# Altium project Hall_Voltage.PrjPcb
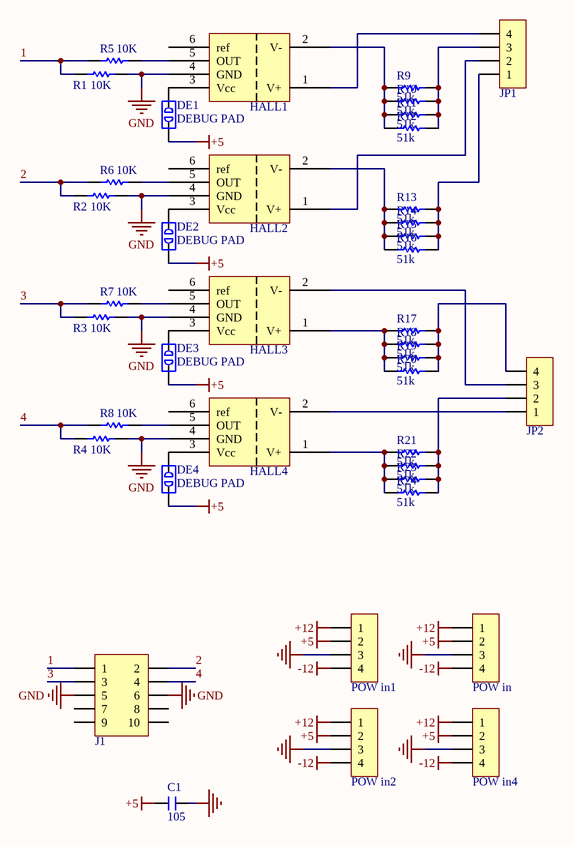
[diagram p0: Hall_Voltage.SchDoc]
1 sheet, 40 parts. Net scope: global (net labels, ports and power ports of the same name join across sheets).
Board file: Hall_Voltage.PcbDoc

## Sheet Hall_Voltage.SchDoc
size A4; Organization: Altium Limited; Address1: L3, 12a Rodborough Rd; Address2: Frenchs Forest; Address3: NSW; Address4: Australia 2086

### Parts
C1  105  [MLCC5.08-A]
DE1  DEBUG PAD  [DEBUG_B]
DE2  DEBUG PAD  [DEBUG_B]
DE3  DEBUG PAD  [DEBUG_B]
DE4  DEBUG PAD  [DEBUG_B]
HALL1  HVS AS5/3.3  [HVS AS5/3.3]  (value not drawn)
HALL2  HVS AS5/3.3  [HVS AS5/3.3]  (value not drawn)
HALL3  HVS AS5/3.3  [HVS AS5/3.3]  (value not drawn)
HALL4  HVS AS5/3.3  [HVS AS5/3.3]  (value not drawn)
J1  Header 5X2  [IDC2.54-LI-2x5P]  (value not drawn)
JP1  HDR-1X4  [KF7620-4P]  (value not drawn)
JP2  HDR-1X4  [KF7620-4P]  (value not drawn)
POW_in  HDR-1X4  [KF2510-LI-4P]  (value not drawn)
POW_in1  HDR-1X4  [KF2510-LI-4P]  (value not drawn)
POW_in2  HDR-1X4  [KF2510-LI-4P]  (value not drawn)
POW_in4  HDR-1X4  [KF2510-LI-4P]  (value not drawn)
R1  10K  [RS 1/4W]
R2  10K  [RS 1/4W]
R3  10K  [RS 1/4W]
R4  10K  [RS 1/4W]
R5  10K  [RS 1/4W]
R6  10K  [RS 1/4W]
R7  10K  [RS 1/4W]
R8  10K  [RS 1/4W]
R9  51k  [RS 2W-V6]
R10  51k  [RS 2W-V6]
R11  51k  [RS 2W-V6]
R12  51k  [RS 2W-V6]
R13  51k  [RS 2W-V6]
R14  51k  [RS 2W-V6]
R15  51k  [RS 2W-V6]
R16  51k  [RS 2W-V6]
R17  51k  [RS 2W-V6]
R18  51k  [RS 2W-V6]
R19  51k  [RS 2W-V6]
R20  51k  [RS 2W-V6]
R21  51k  [RS 2W-V6]
R22  51k  [RS 2W-V6]
R23  51k  [RS 2W-V6]
R24  51k  [RS 2W-V6]

### Nets
+5: C1.1 DE1.1 DE2.1 DE3.1 DE4.1 POW_in.2 POW_in1.2 POW_in2.2 POW_in4.2
+12: POW_in.1 POW_in1.1 POW_in2.1 POW_in4.1
-12: POW_in.4 POW_in1.4 POW_in2.4 POW_in4.4
GND: C1.2 HALL1.4(GND) HALL2.4(GND) HALL3.4(GND) HALL4.4(GND) J1.5 J1.6 POW_in.3 POW_in1.3 POW_in2.3 POW_in4.3 R1.2 R2.2 R3.2 R4.2
1: J1.1 R1.1 R5.2
2: J1.2 R2.1 R6.2
3: J1.3 R3.1 R7.2
4: J1.4 R4.1 R8.2
NetDE1_2: DE1.2 HALL1.3(Vcc)
NetDE2_2: DE2.2 HALL2.3(Vcc)
NetDE3_2: DE3.2 HALL3.3(Vcc)
NetDE4_2: DE4.2 HALL4.3(Vcc)
NetHALL1_1: HALL1.1(V+) JP1.4
NetHALL1_2: HALL1.2(V-) R9.1 R10.1 R11.1 R12.1
NetHALL1_5: HALL1.5(OUT) R5.1
NetHALL2_1: HALL2.1(V+) JP1.2
NetHALL2_2: HALL2.2(V-) R13.1 R14.1 R15.1 R16.1
NetHALL2_5: HALL2.5(OUT) R6.1
NetHALL3_1: HALL3.1(V+) R17.1 R18.1 R19.1 R20.1
NetHALL3_2: HALL3.2(V-) JP2.3
NetHALL3_5: HALL3.5(OUT) R7.1
NetHALL4_1: HALL4.1(V+) R21.1 R22.1 R23.1 R24.1
NetHALL4_2: HALL4.2(V-) JP2.1
NetHALL4_5: HALL4.5(OUT) R8.1
NetJP1_1: JP1.1 R13.2 R14.2 R15.2 R16.2
NetJP1_3: JP1.3 R9.2 R10.2 R11.2 R12.2
NetJP2_2: JP2.2 R21.2 R22.2 R23.2 R24.2
NetJP2_4: JP2.4 R17.2 R18.2 R19.2 R20.2

Not connected (* = marked no-connect by the designer): HALL1 6(ref); HALL2 6(ref); HALL3 6(ref); HALL4 6(ref); J1 7 8 9 10

### Notes on the sheet
- Title
- Size:
- Date:
- A4
- Number:
- Time:
- Revision:
- Sheet
- of
- File:

### Library data of the parts
C1 = C-MLCC: 独石电容; 淘宝ID: 小糖豆的小窝窝; BOM名称: 独石电容; 下单链接: https://item.taobao.com/item.htm?ft=t&id=613637044352
DE1-DE4 = DEBUG: 调试断点焊盘; 淘宝ID: 小糖豆的小窝窝; BOM名称: 调试断点焊盘; 下单链接: https://item.taobao.com/item.htm?ft=t&id=613637044352
HALL1-HALL4 = HVS AS5/3.3: 霍尔电压传感器
J1 = Header 5X2: 5*2P接插件; 淘宝ID: 小糖豆的小窝窝; BOM名称: 5*2P接插件; 下单链接: https://item.taobao.com/item.htm?ft=t&id=613637044352
JP1 JP2 POW_in POW_in1 POW_in2 POW_in4 = Header 4: 4P接插件; 淘宝ID: 小糖豆的小窝窝; BOM名称: 4P接插件; 下单链接: https://item.taobao.com/item.htm?ft=t&id=613637044352
R1-R24 = Res: 色环电阻; 淘宝ID: 小糖豆的小窝窝; BOM名称: 色环电阻; 下单链接: https://item.taobao.com/item.htm?ft=t&id=613637044352